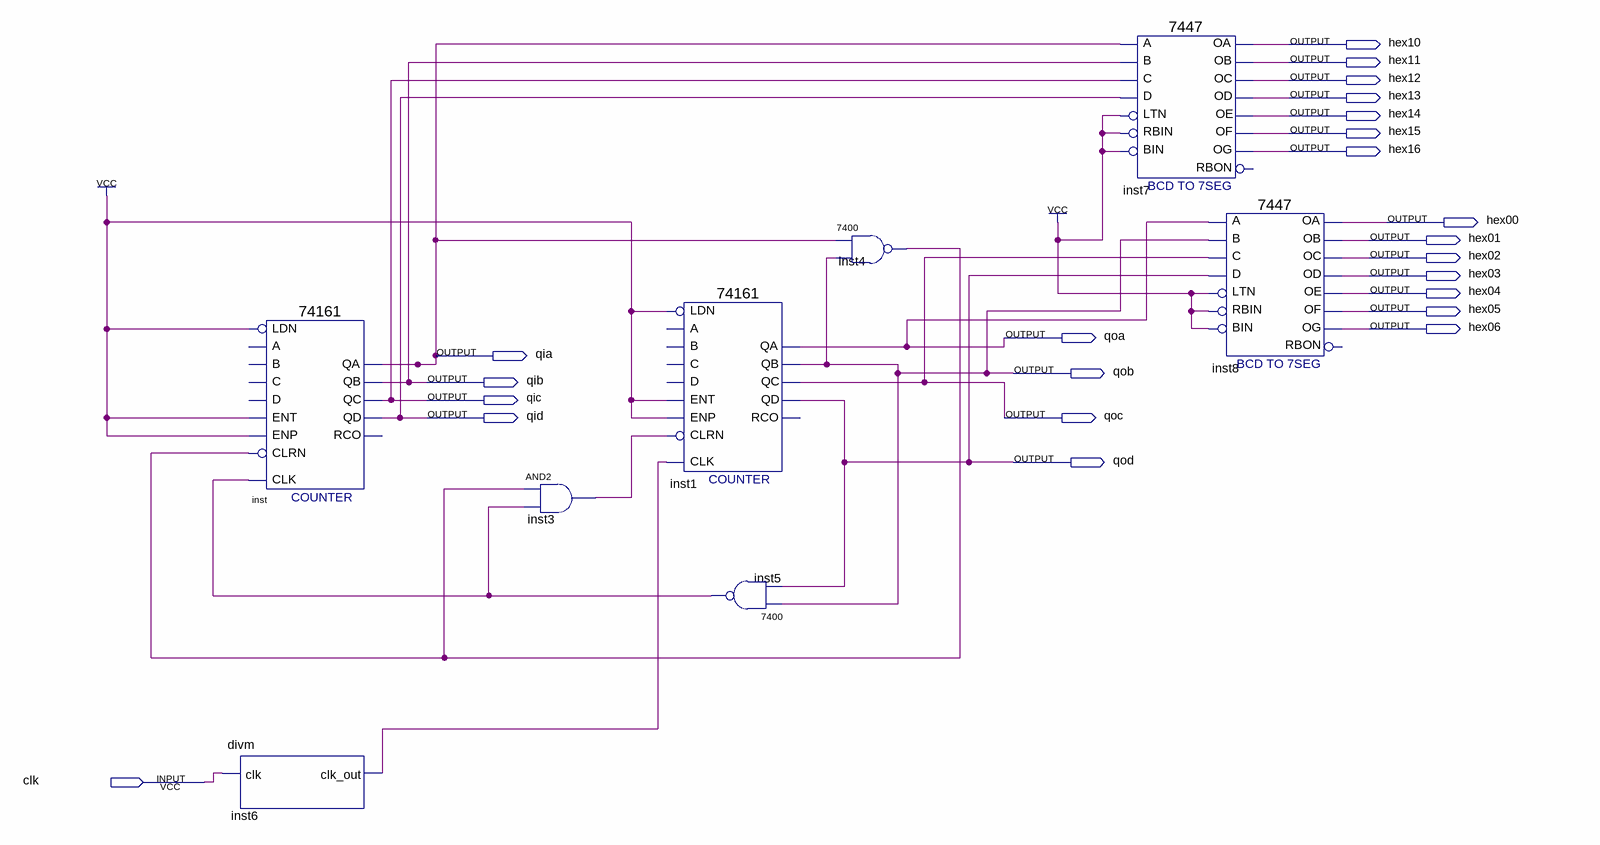
[diagram p0: schematic sheet]
// Quartus schematic exp4-3.bdf as structural Verilog: 8 symbols, 23 pins
module \exp4-3  (
  input  clk,
  output hex10,
  output hex11,
  output hex12,
  output hex13,
  output hex14,
  output hex15,
  output hex16,
  output hex00,
  output hex01,
  output hex02,
  output hex03,
  output hex04,
  output hex05,
  output hex06,
  output qoa,
  output qia,
  output qob,
  output qib,
  output qic,
  output qid,
  output qoc,
  output qod
);

  wire inst3_out, inst4_1, inst5_1, inst6_clk_out;

  divm inst6 (.clk(clk), .clk_out(inst6_clk_out));
  \74161  inst (
    .CLRN(inst4_1), .CLK(inst5_1), .ENP(1'b1), .LDN(1'b1), .ENT(1'b1), .QD(qid), .QC(qic), .QB(qib), .QA(qia));  // open: A, D, B, C, RCO
  and inst3 (inst3_out, inst4_1, inst5_1);
  \74161  inst1 (
    .CLRN(inst3_out), .CLK(inst6_clk_out), .ENP(1'b1), .LDN(1'b1), .ENT(1'b1), .QD(qod), .QC(qoc), .QB(qob),
    .QA(qoa));  // open: A, D, B, C, RCO
  \7400  inst5 (.\3 (qod), .\2 (qob), .\1 (inst5_1));
  \7400  inst4 (.\3 (qob), .\2 (qia), .\1 (inst4_1));
  \7447  inst7 (
    .LTN(1'b1), .B(qib), .C(qic), .D(qid), .RBIN(1'b1), .BIN(1'b1), .A(qia), .OB(hex11), .OC(hex12),
    .OE(hex14), .OD(hex13), .OF(hex15), .OG(hex16), .OA(hex10));  // open: RBON
  \7447  inst8 (
    .LTN(1'b1), .B(qob), .C(qoc), .D(qod), .RBIN(1'b1), .BIN(1'b1), .A(qoa), .OB(hex01), .OC(hex02),
    .OE(hex04), .OD(hex03), .OF(hex05), .OG(hex06), .OA(hex00));  // open: RBON
endmodule
